# Altium schematic sheet Sheet1.SchDoc
size A; SheetNumber: 1; SheetTotal: 3
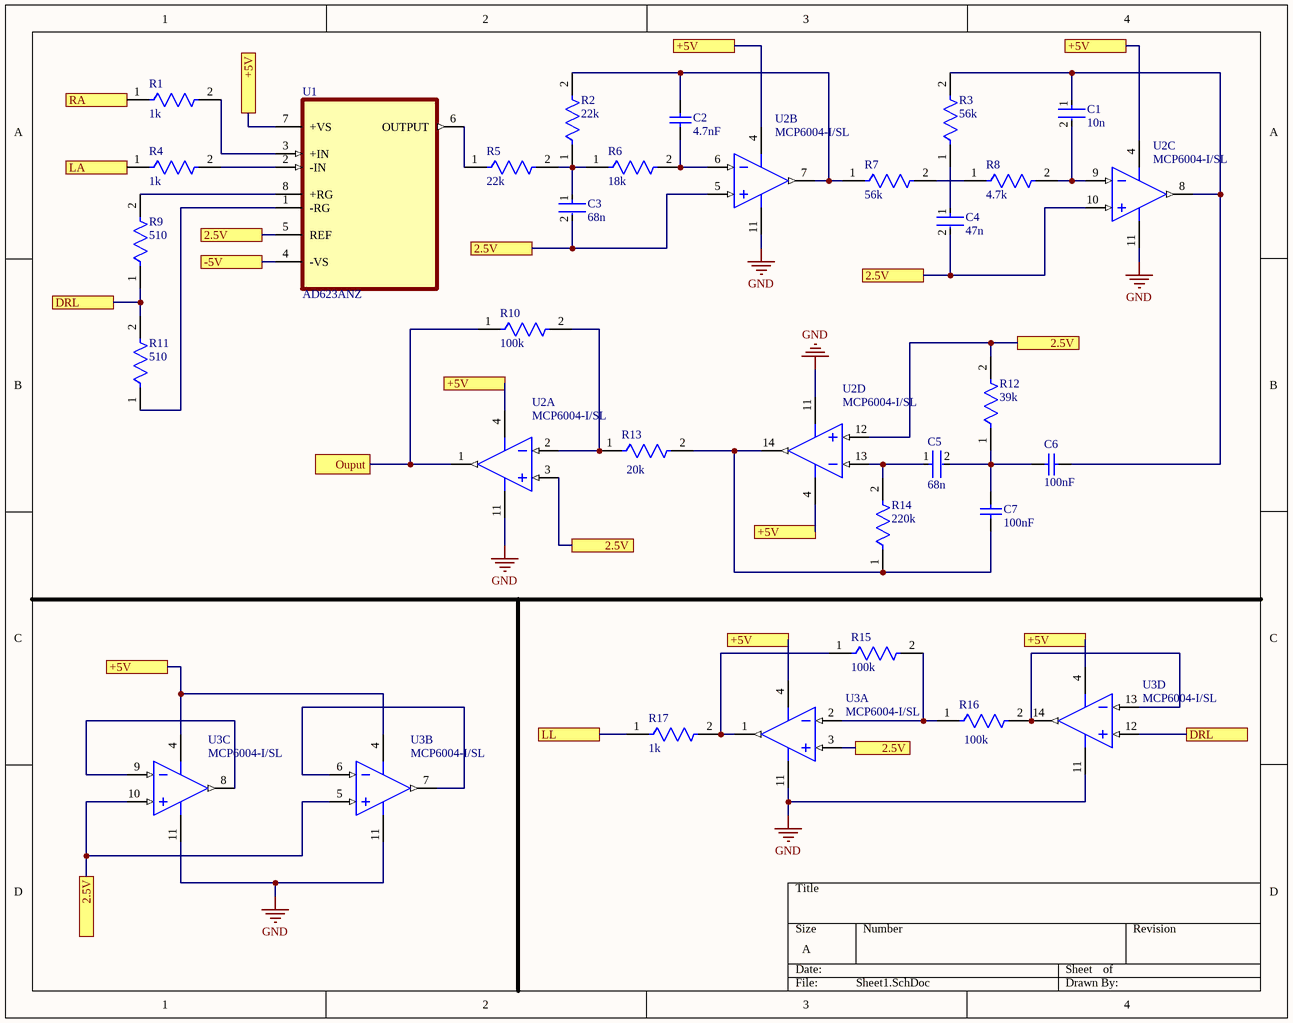
[diagram p0: Sheet1.SchDoc]

## Parts
C1  10n  [FP-C1206C-EB-MFG]
C2  4.7nF  [CAPC1206(3216)170_M]
C3  68n  [FP-C1206C-EB-MFG]
C4  47n  [FP-C1206C-EB-MFG]
C5  68n  [FP-C1206C-EB-MFG]
C6  100nF  [CAPC1210(3225)115_M]
C7  100nF  [CAPC1210(3225)115_M]
R1  1k  [FP-ESR03-IPC_A]
R2  22k  [FP-CRGP0603-IPC_C]
R3  56k  [FP-ESR03-IPC_C]
R4  1k  [FP-ESR03-IPC_A]
R5  22k  [FP-CRGP0603-IPC_C]
R6  18k  [FP-ESR03-MFG]
R7  56k  [FP-ESR03-IPC_C]
R8  4.7k  [FP-CRGP0603-IPC_C]
R9  510  [FP-ESR03-IPC_A]
R10  100k  [FP-CRGP0603-IPC_C]
R11  510  [FP-ESR03-IPC_A]
R12  39k  [FP-CRGP0603-IPC_C]
R13  20k  [FP-ESR03-IPC_A]
R14  220k  [FP-ESR03-MFG]
R15  100k  [FP-CRGP0603-IPC_C]
R16  100k  [FP-CRGP0603-IPC_C]
R17  1k  [FP-ESR03-IPC_A]
U1  AD623ANZ  [DIP254P762X533-8]
U2  MCP6004-I/SL  [SOIC-SL14_M]  (parts A,B,C,D of 4)
U3  MCP6004-I/SL  [SOIC-SL14_M]  (parts A,B,C,D of 4)

## Ports
2.5V, +5V, -5V, DRL, LA, LL, Ouput, RA

## Nets
GND: U2.11(VSS) U3.11(VSS)
2.5V: C3.2 C4.2 R12.2 U1.5(REF) U2.3(VINA+) U2.5(VINB+) U2.10(VINC+) U2.12(VIND+) U3.3(VINA+) U3.5(VINB+) U3.10(VINC+) ; port 2.5V
+5V: U1.7(+VS) U2.4(VDD) U3.4(VDD) ; port +5V
-5V: U1.4(-VS) ; port -5V
DRL: R9.1 R11.2 U3.12(VIND+) ; port DRL
LA: R4.1 ; port LA
LL: R17.1 ; port LL
Ouput: R10.1 U2.1(VOUTA) ; port Ouput
RA: R1.1 ; port RA
NetC1_1: C1.1 C6.2 R3.2 U2.8(VOUTC)
NetC1_2: C1.2 R8.2 U2.9(VINC-)
NetC2_1: C2.1 R6.2 U2.6(VINB-)
NetC2_2: C2.2 R2.2 R7.1 U2.7(VOUTB)
NetC3_1: C3.1 R2.1 R5.2 R6.1
NetC4_1: C4.1 R3.1
NetC5_1: C5.1 R14.2 U2.13(VIND-)
NetC5_2: C5.2 C6.1 C7.2 R12.1
NetC7_1: C7.1 R13.2 R14.1 U2.14(VOUTD)
NetR1_2: R1.2 U1.3(+IN)
NetR4_2: R4.2 U1.2(-IN)
NetR5_1: R5.1 U1.6(OUTPUT)
NetR7_2: R7.2 R8.1
NetR9_2: R9.2 U1.8(+RG)
NetR10_2: R10.2 R13.1 U2.2(VINA-)
NetR11_1: R11.1 U1.1(-RG)
NetR15_1: R15.1 R17.2 U3.1(VOUTA)
NetR15_2: R15.2 R16.1 U3.2(VINA-)
NetR16_2: R16.2 U3.13(VIND-) U3.14(VOUTD)
NetU3_6: U3.6(VINB-) U3.7(VOUTB)
NetU3_8: U3.8(VOUTC) U3.9(VINC-)

## Library data of the parts
C1 = CMP-1037-03498-2: CAP CER 10000PF 50V NP0 1206; Manufacturer: KEMET; Manufacturer Part Number: C1206C103F5GACTU; Value: 10,000 pF; Material: Ceramic; Temperature Characteristic: C0G; Tolerance: 0.01; Automotive Grade: Grade 0; Temperature Coefficient: 15%; Digikey Description: CAP CER 10000PF 50V NP0 1206; Device Class L1: Passive Components; Device Class L2: Capacitors; Capacitance: 10,000 pF; Octopart: https://octopart.com/c1206c103f5gactu-kemet-19050582; Voltage Rating: 50 V; Height: 0.88mm; ComponentLink2Description: Datasheet; ComponentLink2URL: https://content.kemet.com/datasheets/KEM_C1007_X8R_ULTRA_150C_SMD.pdf; Lead Free: Yes; Temperature Range Low: -55°C; Ipc Land Pattern Name: CAPC320160X78; RoHS: TRUE; Temperature: -55°C to +150°C; Category: Cap; Package: C1206C-EB; Temperature Range High: +150°C; Automotive: Yes; Device Class L3: Ceramic Capacitors
C2 = CMP-1037-03108-1: CAP 4.7nF 50V ±1% 1206 (3216 Metric) Thickness 1.7mm SMD; Tolerance: Â±1%; Case-EIA: 1206; Case-Metric: 3216; Rated Voltage: 50 V; Technology: SMT; Value: 4.7nF; Max Thickness: 1.7 mm
C3 C5 = CMP-1037-04086-2: CAP CER 0.068UF 50V NP0 1206; Manufacturer Part Number: C1206C683F5GACTU; Manufacturer: KEMET; Temperature Characteristic: C0G; Tolerance: 0.01; Temperature Coefficient: 15%; Value: 68,000 pF; Automotive Grade: Grade 0; Material: Ceramic; ComponentLink2Description: Datasheet; Lead Free: Yes; Voltage Rating: 50 V; RoHS: TRUE; ComponentLink2URL: https://content.kemet.com/datasheets/KEM_C1007_X8R_ULTRA_150C_SMD.pdf; Device Class L2: Capacitors; Category: Cap; Height: 0.88mm; Device Class L3: Ceramic Capacitors; Mouser Description: Multilayer Ceramic Capacitors MLCC - SMD/SMT 50volts 0.068uF 1% C0G; Octopart: https://octopart.com/c1206c683f5gactu-kemet-19050752; Package: C1206C-EB; Automotive: Yes; Temperature Range High: +150°C; Temperature: -55°C to +150°C; Device Class L1: Passive Components; Digikey Description: CAP CER 0.068UF 50V NP0 1206; Capacitance: 68,000 pF; Ipc Land Pattern Name: CAPC320160X78; Temperature Range Low: -55°C
C4 = CMP-1037-03977-2: CAP CER 0.047UF 50V NP0 1206; Manufacturer: KEMET; Manufacturer Part Number: C1206C473F5GACTU; Tolerance: 0.01; Automotive Grade: Grade 0; Value: 47,000 pF; Material: Ceramic; Temperature Coefficient: 15%; Temperature Characteristic: C0G; Device Class L1: Passive Components; Lead Free: Yes; Voltage Rating: 50 V; ComponentLink2URL: https://content.kemet.com/datasheets/KEM_C1007_X8R_ULTRA_150C_SMD.pdf; Device Class L2: Capacitors; Capacitance: 47,000 pF; Temperature Range High: +150°C; RoHS: TRUE; Temperature Range Low: -55°C; Category: Cap; Mouser Description: Multilayer Ceramic Capacitors MLCC - SMD/SMT 50volts 0.047uF 1% C0G; Height: 0.88mm; Device Class L3: Ceramic Capacitors; ComponentLink2Description: Datasheet; Octopart: https://octopart.com/c1206c473f5gactu-kemet-13140371; Digikey Description: CAP CER 0.047UF 50V NP0 1206; Package: C1206C-EB; Automotive: Yes; Temperature: -55°C to +150°C; Ipc Land Pattern Name: CAPC320160X78
C6 C7 = CMP-1038-01632-1: CAP 100nF 16V ±1% 1210 (3225 Metric) Thickness 1.1mm SMD; Case-Metric: 3225; Tolerance: Â±1%; Case-EIA: 1210; Value: 100nF; Technology: SMT; Max Thickness: 1.1 mm; Rated Voltage: 16 V
R1 R4 R17 = CMP-08839-029483-1: 1kΩ ±1% 0.25W 0603 Anti-Surge Chip Resistor AEC-Q200; Power Rating: 250mW; Resistance: 1kR; Temperature Coefficient: 100ppm/°C; Series: ESR; Max Operating Temperature: 155°C; Case Code (Metric): 1608; Package Quantity: 1; Case/Package: 0603; Size Code: 0603; Case Code (Imperial): 0603; Min Operating Temperature: -55°C; Tolerance: 1%; Max Power Dissipation: 250mW; Number of Terminations: 2; RoHS Compliant: Yes; Lead Free: Lead Free; Packaging: Tape and Reel; Height: 0.022inch; Width: 0.031inch; Features: Automotive AEC-Q200; Resistor Type: Thick Film; Length: 0.063inch
R2 R5 = CMP-03211-006681-1: CRGP 0603 22K 1%; Manufacturer Part Number: CRGP0603F22K; Manufacturer: TE; Resistance: 22KΩ; Power Rating: 0.25W; Temperature Coefficient: ±100ppm/°C; Tolerance: 0.01; Voltage Rating: 50V; Value: 22KΩ; Lead Free: Yes; Device Class L3: Chip SMD Resistors; Ipc Land Pattern Name: RESC16080X45; Composition: Thick Film; Octopart: https://octopart.com/crgp0603f22k-te+connectivity-91018742; RoHS: TRUE; ComponentLink2Description: Datasheet; Digikey Description: CRGP 0603 22K 1%; Category: Res; Temperature: -55°C to +155°C; Temperature Range High: +155°C; Series: CRGP; ComponentLink2URL: https://www.te.com/commerce/DocumentDelivery/DDEController?Action=srchrtrv&DocNm=9-1773463-9&DocType=DS&DocLang=English; Device Class L2: Resistors; Height: 0.55mm; Ambient Temperature Range High: +70°C; Device Class L1: Passive Components; Automotive: No; Temperature Range Low: -55°C; Package: CRGP0603
R3 R7 = CMP-08839-002556-1: 56kΩ ±1% 0.25W 0603 Anti-Surge Chip Resistor AEC-Q200; Temperature Coefficient: 100ppm/°C; Max Power Dissipation: 250mW; Resistance: 56kR; Series: ESR; Packaging: Tape and Reel; Features: Automotive AEC-Q200; Min Operating Temperature: -55°C; Tolerance: 1%; RoHS Compliant: Yes; Case/Package: 0603; Resistor Type: Thick Film; Max Operating Temperature: 155°C; Number of Terminations: 2
R6 = CMP-08839-007579-1: 18kΩ ±1% 0.25W 0603 Anti-Surge Chip Resistor AEC-Q200; Temperature Coefficient: 100ppm/°C; Max Power Dissipation: 250mW; Resistance: 18kR; Max Operating Temperature: 155°C; Height: 0.022inch; Packaging: Tape and Reel; Package Quantity: 5000; Number of Terminations: 2; RoHS Compliant: Yes; Width: 0.031inch; Series: ESR03; Case/Package: 0603; Resistor Type: Thick Film; Min Operating Temperature: -55°C; Tolerance: 1%; Length: 0.063inch
R8 = CMP-03211-002408-1: CRGP0603 4.7KΩ 0.25W ±100ppm/°C 1% 50V; Manufacturer Part Number: CRGP0603F4K7; Manufacturer: TE; Tolerance: 0.01; Device Class L1: Passive Components; Temperature Range High: +155°C; Value: 4.7KΩ; ComponentLink2Description: Datasheet; Resistance: 4.7KΩ; RoHS: TRUE; Octopart: https://octopart.com/crgp0603f4k7-te+connectivity-91018764; Ipc Land Pattern Name: RESC16080X45; Lead Free: Yes; Temperature: -55°C to +155°C; Power Rating: 0.25W; Category: Res; Package: CRGP0603; Voltage Rating: 50V; ComponentLink2URL: https://www.te.com/commerce/DocumentDelivery/DDEController?Action=srchrtrv&DocNm=9-1773463-9&DocType=DS&DocLang=English; Temperature Coefficient: ±100ppm/°C; Height: 0.55mm; Automotive: No; Temperature Range Low: -55°C; Device Class L2: Resistors; Series: CRGP; Composition: Thick Film; Device Class L3: Chip SMD Resistors; Ambient Temperature Range High: +70°C
R9 = CMP-08839-005099-1: 510Ω ±1% 0.25W 0603 Anti-Surge Chip Resistor AEC-Q200; Resistance: 510R; Max Power Dissipation: 250mW; Temperature Coefficient: 100ppm/°C; Series: ESR; Min Operating Temperature: -55°C; Resistor Type: Thick Film; Case/Package: 0603; Packaging: Tape and Reel; Tolerance: 1%; Features: Automotive AEC-Q200; Number of Terminations: 2; Max Operating Temperature: 155°C
R10 R15 R16 = CMP-03211-000885-1: CRGP 0603 100K 1%; Manufacturer: TE; Manufacturer Part Number: CRGP0603F100K; Power Rating: 0.25W; Resistance: 100KΩ; Voltage Rating: 50V; Value: 100KΩ; Tolerance: 0.01; Temperature Coefficient: ±100ppm/°C; Device Class L2: Resistors; Temperature: -55°C to +155°C; Temperature Range High: +155°C; Ambient Temperature Range High: +70°C; Lead Free: Yes; RoHS: TRUE; Octopart: https://octopart.com/crgp0603f100k-te+connectivity-91018719; Digikey Description: CRGP 0603 100K 1%; Automotive: No; ComponentLink2Description: Datasheet; Category: Res; Ipc Land Pattern Name: RESC16080X45; Device Class L3: Chip SMD Resistors; Composition: Thick Film; Temperature Range Low: -55°C; Height: 0.55mm; Device Class L1: Passive Components; Series: CRGP; Package: CRGP0603; ComponentLink2URL: https://www.te.com/commerce/DocumentDelivery/DDEController?Action=srchrtrv&DocNm=9-1773463-9&DocType=DS&DocLang=English
R11 = CMP-08839-005099-1: Resistance: 510R; Max Power Dissipation: 250mW; Tolerance: 1%; Temperature Coefficient: 100ppm/°C; Series: ESR; Min Operating Temperature: -55°C; Resistor Type: Thick Film; Case/Package: 0603; Packaging: Tape and Reel; Features: Automotive AEC-Q200; Number of Terminations: 2; Max Operating Temperature: 155°C
R12 = CMP-03211-000998-1: CRGP0603 39KΩ 0.25W ±100ppm/°C 1% 50V; Manufacturer: TE; Manufacturer Part Number: CRGP0603F39K; Tolerance: 0.01; Package: CRGP0603; Temperature: -55°C to +155°C; Device Class L1: Passive Components; Value: 39KΩ; RoHS: TRUE; Device Class L3: Chip SMD Resistors; Octopart: https://octopart.com/crgp0603f39k-te+connectivity-91018756; Resistance: 39KΩ; Automotive: No; Lead Free: Yes; Height: 0.55mm; Category: Res; Series: CRGP; Temperature Range High: +155°C; Temperature Coefficient: ±100ppm/°C; Composition: Thick Film; Temperature Range Low: -55°C; ComponentLink2URL: https://www.te.com/commerce/DocumentDelivery/DDEController?Action=srchrtrv&DocNm=9-1773463-9&DocType=DS&DocLang=English; ComponentLink2Description: Datasheet; Device Class L2: Resistors; Ambient Temperature Range High: +70°C; Ipc Land Pattern Name: RESC16080X45; Power Rating: 0.25W; Voltage Rating: 50V
R13 = CMP-08839-029148-1: 20kΩ ±1% 0.25W 0603 Anti-Surge Chip Resistor AEC-Q200; Resistance: 20kR; Max Power Dissipation: 250mW; Temperature Coefficient: 100ppm/°C; Max Operating Temperature: 155°C; RoHS Compliant: Yes; Length: 0.063inch; Number of Terminations: 2; Tolerance: 1%; Height: 0.022inch; Width: 0.031inch; Case Code (Metric): 1608; Min Operating Temperature: -55°C; Case/Package: 0603; Case Code (Imperial): 0603; Packaging: Tape and Reel; Resistor Type: Thick Film; Package Quantity: 1; Features: Automotive AEC-Q200; Series: ESR
R14 = CMP-08839-027973-1: 220kΩ ±1% 0.25W 0603 Anti-Surge Chip Resistor AEC-Q200; Max Power Dissipation: 250mW; Temperature Coefficient: 100ppm/°C; Resistance: 220kR; Number of Terminations: 2; Packaging: Tape and Reel; Tolerance: 1%; Height: 0.022inch; Case Code (Imperial): 0603; Min Operating Temperature: -55°C; Package Quantity: 1; Features: Automotive AEC-Q200; Resistor Type: Thick Film; RoHS Compliant: Yes; Width: 0.031inch; Length: 0.063inch; Max Operating Temperature: 155°C; Series: ESR; Case/Package: 0603; Case Code (Metric): 1608
U1 = AD623ANZ: Single and Dual-Supply, Rail-to-Rail, Low Cost Instrumentation Amplifier; MF: Analog Devices; SnapEDA_Link: https://www.snapeda.com/parts/AD623ANZ/Analog+Devices/view-part/?ref=snap; Package: PDIP-8 Analog Devices; Value: *; MP: AD623ANZ; Check_prices: https://www.snapeda.com/parts/AD623ANZ/Analog+Devices/view-part/?ref=eda
U2 U3 = CMP-0187-00321-3: None; Number of Channels: 4; Amplifier Type: GENERAL PURPOSE; Common Mode Rejection Ratio: 60dB; Bandwidth: 1MHz; Voltage Gain: 112dB; Min Supply Voltage: 1.8V; Slew Rate-Nom: 0.6V/µs; Supply Current: 100uA; Input Offset Voltage-Max: 4.5mV; Power Supply Rejection Ratio (PSRR): 86dB; Output Current: 23mA; Operating Supply Voltage: 5.5V; Input Bias Current: 1pA; Max Supply Voltage: 6V; RoHS Compliant: Yes; Technology: CMOS; Radiation Hardening: No; Number of Elements: 4; REACH SVHC: No SVHC; Number of Amplifiers: 4; Lead Free: Lead Free; Contact Plating: Tin; Max Operating Temperature: 85°C; Packaging: Rail/Tube; Number of Pins: 14; Case/Package: SOIC; Width: 3.9mm; Length: 8.65mm; Unity Gain Bandwidth Product: 1MHz; Gain Bandwidth Product: 1MHz; Input Offset Voltage (Vos): 4.5mV; Package Quantity: 57; Number of Circuits: 4; Min Operating Temperature: -40°C; Nominal Supply Current: 100uA; Height: 1.25mm; Slew Rate: 0.6V/µs; Mount: Surface Mount